# Altium schematic sheet ADC_3_Section.SchDoc
size A4; DocumentNumber: 8; SheetNumber: 8; SheetTotal: 11
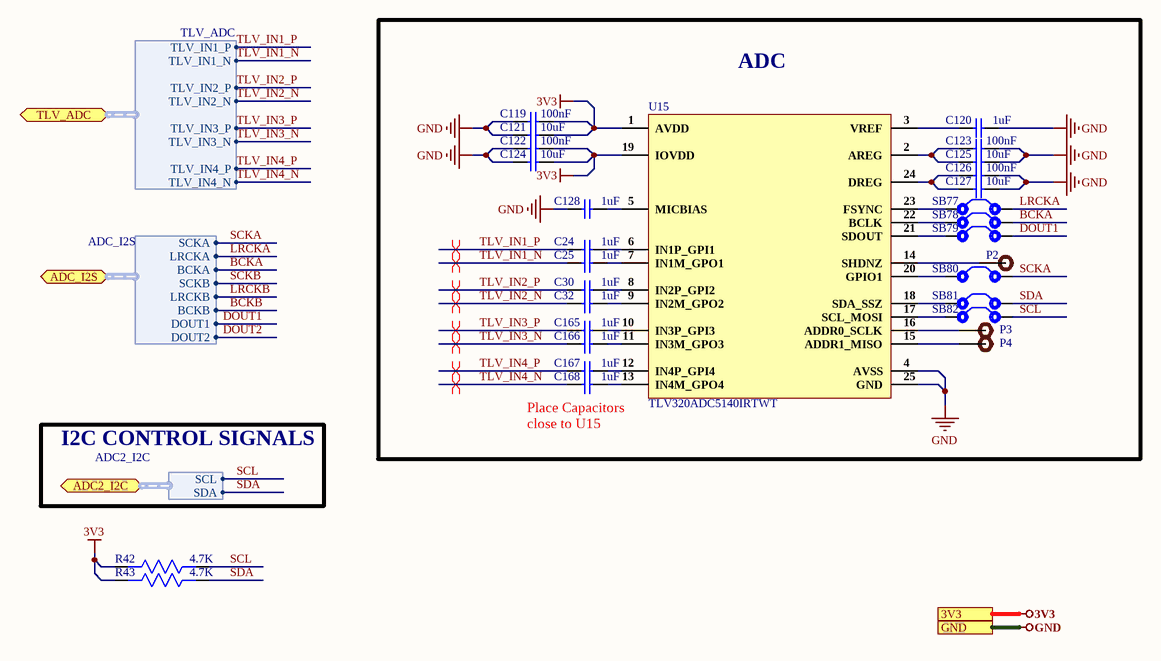
[diagram p0: ADC_3_Section.SchDoc]

## Parts
C24  1uF  [Cap-0402]
C25  1uF  [Cap-0402]
C30  1uF  [Cap-0402]
C32  1uF  [Cap-0402]
C119  100nF  [Cap-0402]
C120  1uF  [Cap-0402]
C121  10uF  [Cap-0603]
C122  100nF  [Cap-0402]
C123  100nF  [Cap-0402]
C124  10uF  [Cap-0603]
C125  10uF  [Cap-0603]
C126  100nF  [Cap-0402]
C127  10uF  [Cap-0603]
C128  1uF  [Cap-0402]
C165  1uF  [Cap-0402]
C166  1uF  [Cap-0402]
C167  1uF  [Cap-0402]
C168  1uF  [Cap-0402]
P2  TEST POINT  [Test-point]  (value not drawn)
P3  TEST POINT  [Test-point]  (value not drawn)
P4  TEST POINT  [Test-point]  (value not drawn)
R42  4.7K  [Res-0603]
R43  4.7K  [Res-0603]
SB77  Solder Bridge  [Solder Bridge]  (value not drawn)
SB78  Solder Bridge  [Solder Bridge]  (value not drawn)
SB79  Solder Bridge  [Solder Bridge]  (value not drawn)
SB80  Solder Bridge  [Solder Bridge]  (value not drawn)
SB81  Solder Bridge  [Solder Bridge]  (value not drawn)
SB82  Solder Bridge  [Solder Bridge]  (value not drawn)
U15  TLV320ADC5140IRTWT  [24-WQFN (4x4)]

## Blocks framed on the sheet
ADC: C24 C25 C30 C32 C119-C128 C165-C168 P2-P4 SB77-SB82 U15

## Ports
3V3, ADC2_I2C (bidir, harness ADC2_I2C), ADC_I2S (bidir, harness ADC_I2S), GND, TLV_ADC (bidir, harness TLV_ADC)

## Harnesses
ADC2_I2C: SCL, SDA
ADC_I2S: SCKA, LRCKA, BCKA, SCKB, LRCKB, BCKB, DOUT1, DOUT2
TLV_ADC: TLV_IN1_P, TLV_IN1_N, TLV_IN2_P, TLV_IN2_N, TLV_IN3_P, TLV_IN3_N, TLV_IN4_P, TLV_IN4_N

## Nets
3V3: C119.2 C121.2 C122.2 C124.2 R42.2 R43.2 U15.1(AVDD) U15.19(IOVDD) ; port 3V3
GND: C119.1 C120.2 C121.1 C122.1 C123.2 C124.1 C125.2 C126.2 C127.2 C128.1 U15.4(AVSS) U15.25(GND) ; port GND
BCKA: SB78.2 ; port ADC_I2S.BCKA
BCKB: port ADC_I2S.BCKB
DOUT1: SB79.2 ; port ADC_I2S.DOUT1
DOUT2: port ADC_I2S.DOUT2
LRCKA: SB77.1 ; port ADC_I2S.LRCKA
LRCKB: port ADC_I2S.LRCKB
SCKA: SB80.1 ; port ADC_I2S.SCKA
SCKB: port ADC_I2S.SCKB
SCL: R42.1 SB82.1 ; port ADC2_I2C.SCL
SDA: R43.1 SB81.1 ; port ADC2_I2C.SDA
TLV_IN1_N: C25.1 ; port TLV_ADC.TLV_IN1_N
TLV_IN1_P: C24.1 ; port TLV_ADC.TLV_IN1_P
TLV_IN2_N: C32.1 ; port TLV_ADC.TLV_IN2_N
TLV_IN2_P: C30.1 ; port TLV_ADC.TLV_IN2_P
TLV_IN3_N: C166.1 ; port TLV_ADC.TLV_IN3_N
TLV_IN3_P: C165.1 ; port TLV_ADC.TLV_IN3_P
TLV_IN4_N: C168.1 ; port TLV_ADC.TLV_IN4_N
TLV_IN4_P: C167.1 ; port TLV_ADC.TLV_IN4_P
NetC24_2: C24.2 U15.6(IN1P_GPI1)
NetC25_2: C25.2 U15.7(IN1M_GPO1)
NetC30_2: C30.2 U15.8(IN2P_GPI2)
NetC32_2: C32.2 U15.9(IN2M_GPO2)
NetC120_1: C120.1 U15.3(VREF)
NetC123_1: C123.1 C125.1 U15.2(AREG)
NetC126_1: C126.1 C127.1 U15.24(DREG)
NetC128_2: C128.2 U15.5(MICBIAS)
NetC165_2: C165.2 U15.10(IN3P_GPI3)
NetC166_2: C166.2 U15.11(IN3M_GPO3)
NetC167_2: C167.2 U15.12(IN4P_GPI4)
NetC168_2: C168.2 U15.13(IN4M_GPO4)
NetP2_1: P2.1 U15.14(SHDNZ)
NetP3_1: P3.1 U15.16(ADDR0_SCLK)
NetP4_1: P4.1 U15.15(ADDR1_MISO)
NetSB77_2: SB77.2 U15.23(FSYNC)
NetSB78_1: SB78.1 U15.22(BCLK)
NetSB79_1: SB79.1 U15.21(SDOUT)
NetSB80_2: SB80.2 U15.20(GPIO1)
NetSB81_2: SB81.2 U15.18(SDA_SSZ)
NetSB82_2: SB82.2 U15.17(SCL_MOSI)

## Layout directives
differential pair; differential pair class OUT1_Lines; net class OUT1: TLV_IN1_N, TLV_IN1_P, TLV_IN2_N, TLV_IN2_P, TLV_IN3_N, TLV_IN3_P, TLV_IN4_N, TLV_IN4_P

## Notes on the sheet
- I2C CONTROL SIGNALS
- Place Capacitors close to U15
- File:
- Title:
- Date:
- Page
- Num:
- Total:
- Drawn By: Huzaifa Ali

## Library data of the parts
C24 C25 C30 C32 C120 C128 C165-C168 = CC0402KRX5R8BB105: CAP CER 1UF 25V X5R 0402; Manufacturer: Yageo; Tolerance: 10%; Supplier 1: Mouser; Manufacturer Part Number: CC0402KRX5R8BB105; RoHS: Yes; Category: Ceramic Capacitors; Stock 1: 91975; Pricing 1: 1=0.30000, 10=0.20400, 50=0.20400, 100=0.11600, 1000=0.07200, 10000=0.05900 (USD); Mount: Surface Mount; Case/Package: 0402; Case Code (Metric): 1005; Case Code (Imperial): 0402; Weight: 2.3E-05oz; Min Operating Temperature: -55°C; Max Operating Temperature: 85°C; Packaging: Tape and Reel; Capacitance: 1uF; Voltage Rating: 25V; Dielectric: X5R; Termination: SMD/SMT; Voltage Rating (DC): 25V; Package Quantity: 10000; Length: 0.039inch; Width: 0.02inch; Thickness: 0.022inch; Lead Free: Lead Free; Halogen Free: Halogen Free; RoHS Compliant: Yes; ComponentLink1URL: http://www.mouser.com/ds/2/447/Yageo_UPY-GP_NP0_16V-to-50V_9-358835.pdf?src-supplier=Mouser; ComponentLink1Description: http://www.mouser.com/ds/2/447/Yageo_UPY-GP_NP0_16V-to-50V_9-358835.pdf?src-supplier=Mouser; ComponentLink2URL: http://www.yageo.com/documents/recent/UPY-GPHC_X5R_4V-to-50V_25.pdf?src-supplier=Digi-Key; ComponentLink2Description: http://www.yageo.com/documents/recent/UPY-GPHC_X5R_4V-to-50V_25.pdf?src-supplier=Digi-Key; ComponentLink3URL: https://4donline.ihs.com/images/VipMasterIC/IC/YAGO/YAGO-S-A0006851646/YAGO-S-A0006851646-1.pdf?hkey=6D3A4C79FDBF58556ACFDE234799DDF0&src-supplier=Newark; ComponentLink3Description: https://4donline.ihs.com/images/VipMasterIC/IC/YAGO/YAGO-S-A0006851646/YAGO-S-A0006851646-1.pdf?hkey=6D3A4C79FDBF58556ACFDE234799DDF0&src-supplier=Newark; Supplier Part Number 1: 603-CC402KRX5R8BB105; LCSC Part Number: C326568
C119 C122 C123 C126 = CC0402KRX5R7BB104: CAP CER 0.1UF 16V X5R 0402; Manufacturer: Yageo; Tolerance: 10%; Supplier 1: Mouser; Manufacturer Part Number: CC0402KRX5R7BB104; RoHS: Yes; Category: Ceramic Capacitors; Stock 1: 936792; Pricing 1: 1=0.10000, 10=0.02300, 50=0.02300, 100=0.01100, 1000=0.00600, 10000=0.00400 (USD); Mount: Surface Mount; Case/Package: 0402; Number of Pins: 2; Case Code (Metric): 1005; Case Code (Imperial): 0402; Min Operating Temperature: -55°C; Max Operating Temperature: 85°C; Capacitance: 100nF; Dielectric: X5R; Packaging: Tape and Reel; Voltage Rating: 16V; Package Quantity: 1; Voltage Rating (DC): 16V; Termination: SMD/SMT; Resistor Type: Ceramic; Series: CC; Construction: Flat; Length: 1mm; Width: 0.02inch; Height: 0.5mm; Thickness: 0.022inch; Depth: 0.5mm; Radiation Hardening: No; REACH SVHC: Unknown; Lead Free: Lead Free; Halogen Free: Halogen Free; RoHS Compliant: Yes; ComponentLink1URL: https://datasheet.ciiva.com/155/mlccorderingcode-155879.pdf?src-supplier=Digi-Key; ComponentLink1Description: https://datasheet.ciiva.com/155/mlccorderingcode-155879.pdf?src-supplier=Digi-Key; ComponentLink2URL: https://datasheet.ciiva.com/155/mlccorderingcode-155878.pdf?src-supplier=Digi-Key; ComponentLink2Description: https://datasheet.ciiva.com/155/mlccorderingcode-155878.pdf?src-supplier=Digi-Key; ComponentLink3URL: https://datasheet.ciiva.com/155/mlccorderingcode-155880.pdf?src-supplier=Digi-Key; ComponentLink3Description: https://datasheet.ciiva.com/155/mlccorderingcode-155880.pdf?src-supplier=Digi-Key; ComponentLink4URL: https://datasheet.ciiva.com/11464/upy-gphc-x5r-4v-to-50v-12-11464869.pdf?src-supplier=Avnet; ComponentLink4Description: https://datasheet.ciiva.com/11464/upy-gphc-x5r-4v-to-50v-12-11464869.pdf?src-supplier=Avnet; Supplier Part Number 1: 603-CC402KRX5R7BB104; LCSC Part Number: C106204
C121 C124 C125 C127 = C1608X5R1E106M080AC: CAP CER 10UF 25V X5R 0603; Manufacturer: TDK; Dielectric Material: Ceramic; Tolerance: 20%; Supplier 1: Digi-Key; Manufacturer Part Number: C1608X5R1E106M080AC; Stock 1: 61681; Pricing 1: 1=0.96, 10=0.704, 100=0.483, 500=0.38238, 1000=0.322 (USD); Mount: Surface Mount; Case/Package: 0603; Weight: 7.1E-05oz; Case Code (Imperial): 0603; Case Code (Metric): 1608; Min Operating Temperature: -55°C; Max Operating Temperature: 85°C; Capacitance: 10uF; Packaging: Tape and Reel; Voltage Rating: 25V; Voltage Rating (DC): 25V; Termination: SMD/SMT; Package Quantity: 1; Dielectric: X5R; Composition: Ceramic; Length: 1.6mm; Height: 0.8mm; Width: 0.8mm; Thickness: 0.039inch; Depth: 0.8mm; Lead Free: Lead Free; REACH SVHC: No SVHC; Supplier Part Number 1: 445-9015-1-ND; LCSC Part Number: C2168289
P2-P4 = TEST POINT: Test Point ON
R42 R43 = RC0603JR-074K7L: RES SMD 4.7K OHM 5% 1/10W 0603; Manufacturer: Yageo; Resistance: 4.7kR; Temperature Coefficient: 100ppm/°C; Voltage Rating (DC): 50V; Power Rating: 100mW; Supplier 1: Digi-Key; Manufacturer Part Number: RC0603JR-074K7L; Stock 1: 19706643; Pricing 1: 1=0.1, 10=0.02, 100=0.0081, 1000=0.00362, 2500=0.00314 (USD); Case/Package: 0603; Number of Pins: 2; Case Code (Imperial): 0603; Case Code (Metric): 1608; Min Operating Temperature: -55°C; Max Operating Temperature: 155°C; Tolerance: 5%; Composition: Thick Film; Packaging: Tape and Reel; Voltage Rating: 50V; Termination: SMD/SMT; Military Standard: Not; Length: 1.6mm; Width: 0.8mm; Depth: 0.8mm; REACH SVHC: No SVHC; Lead Free: Lead Free; ComponentLink1URL: http://www.farnell.com/datasheets/443971.pdf?src-supplier=Element14; ComponentLink1Description: http://www.farnell.com/datasheets/443971.pdf?src-supplier=Element14; Supplier Part Number 1: 311-4.7KGRCT-ND; LCSC Part Number: C105428
SB77-SB82 = Solder Bridge: Solder Bridge ON
U15 = TLV320ADC5140IRTWT: IC ADC AUDIO 768K 24WQFN; Manufacturer: Texas Instruments; Supplier 1: Digi-Key; Manufacturer Part Number: TLV320ADC5140IRTWT; RoHS: Yes; Stock 1: 40; Pricing 1: 1=6.07000, 10=5.44900, 25=5.15160, 100=4.46470 (USD); RoHS Compliant: Yes; ComponentLink1URL: http://www.ti.com/general/docs/suppproductinfo.tsp?distId=10&amp;gotoUrl=http%3A%2F%2Fwww.ti.com%2Flit%2Fgpn%2Ftlv320adc5140&src-supplier=Digi-Key; ComponentLink1Description: http://www.ti.com/general/docs/suppproductinfo.tsp?distId=10&amp;gotoUrl=http%3A%2F%2Fwww.ti.com%2Flit%2Fgpn%2Ftlv320adc5140&src-supplier=Digi-Key; Supplier Part Number 1: 296-TLV320ADC5140IRTWTCT-ND; LCSC Part Number: C1852018; Item Type: IC